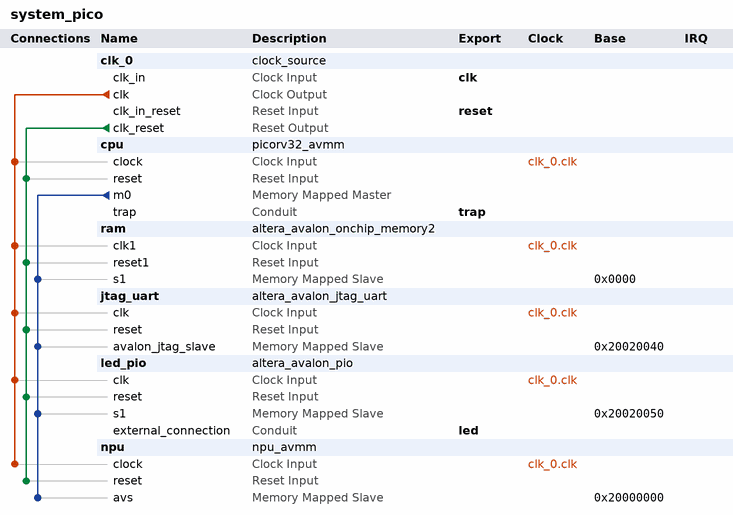
[diagram p0: system contents]
# Platform Designer (Qsys) system system_pico, Cyclone V 5CSEBA6U23I7
# Parameters at their usual value, and those the tool derives, are not listed.
package require -exact qsys 25.1
create_system system_pico
set_project_property DEVICE_FAMILY {Cyclone V}
set_project_property DEVICE 5CSEBA6U23I7

add_instance clk_0 clock_source 25.1
set_instance_parameter_value clk_0 clockFrequency 50000000
set_instance_parameter_value clk_0 resetSynchronousEdges DEASSERT

add_instance cpu picorv32_avmm 1.0

add_instance ram altera_avalon_onchip_memory2 25.1
set_instance_parameter_value ram dataWidth 32
set_instance_parameter_value ram dualPort false
set_instance_parameter_value ram initMemContent true
set_instance_parameter_value ram initializationFileName onchip_init_pico.hex
set_instance_parameter_value ram memorySize 262144
set_instance_parameter_value ram singleClockOperation true
set_instance_parameter_value ram useNonDefaultInitFile true

add_instance jtag_uart altera_avalon_jtag_uart 25.1
set_instance_parameter_value jtag_uart simInteractiveOptions NO_INTERACTIVE_WINDOWS
set_instance_parameter_value jtag_uart writeBufferDepth 1024

add_instance led_pio altera_avalon_pio 25.1
set_instance_parameter_value led_pio direction Output
set_instance_parameter_value led_pio width 8

add_instance npu npu_avmm 1.0
set_instance_parameter_value npu DEPTH 64
set_instance_parameter_value npu N 8

# connections
add_connection clk_0.clk cpu.clock clock
add_connection clk_0.clk jtag_uart.clk clock
add_connection clk_0.clk led_pio.clk clock
add_connection clk_0.clk npu.clock clock
add_connection clk_0.clk ram.clk1 clock
add_connection clk_0.clk_reset cpu.reset reset
add_connection clk_0.clk_reset jtag_uart.reset reset
add_connection clk_0.clk_reset led_pio.reset reset
add_connection clk_0.clk_reset npu.reset reset
add_connection clk_0.clk_reset ram.reset1 reset
add_connection cpu.m0 jtag_uart.avalon_jtag_slave avalon
set_connection_parameter_value cpu.m0/jtag_uart.avalon_jtag_slave baseAddress 0x20020040
add_connection cpu.m0 led_pio.s1 avalon
set_connection_parameter_value cpu.m0/led_pio.s1 baseAddress 0x20020050
add_connection cpu.m0 npu.avs avalon
set_connection_parameter_value cpu.m0/npu.avs baseAddress 0x20000000
add_connection cpu.m0 ram.s1 avalon
set_connection_parameter_value cpu.m0/ram.s1 baseAddress 0x0000

# exported interfaces
add_interface clk clock sink
set_interface_property clk EXPORT_OF clk_0.clk_in
add_interface led conduit end
set_interface_property led EXPORT_OF led_pio.external_connection
add_interface reset reset sink
set_interface_property reset EXPORT_OF clk_0.clk_in_reset
add_interface trap conduit end
set_interface_property trap EXPORT_OF cpu.trap

set_interconnect_requirement {$system} qsys_mm.clockCrossingAdapter HANDSHAKE
set_interconnect_requirement {$system} qsys_mm.enableEccProtection FALSE
set_interconnect_requirement {$system} qsys_mm.insertDefaultSlave FALSE
set_interconnect_requirement {$system} qsys_mm.maxAdditionalLatency 1

save_system system_pico.qsys
